# Altium schematic sheet 00_SYSTEM_OVERVIEW.SchDoc
size 840 x 594 mm
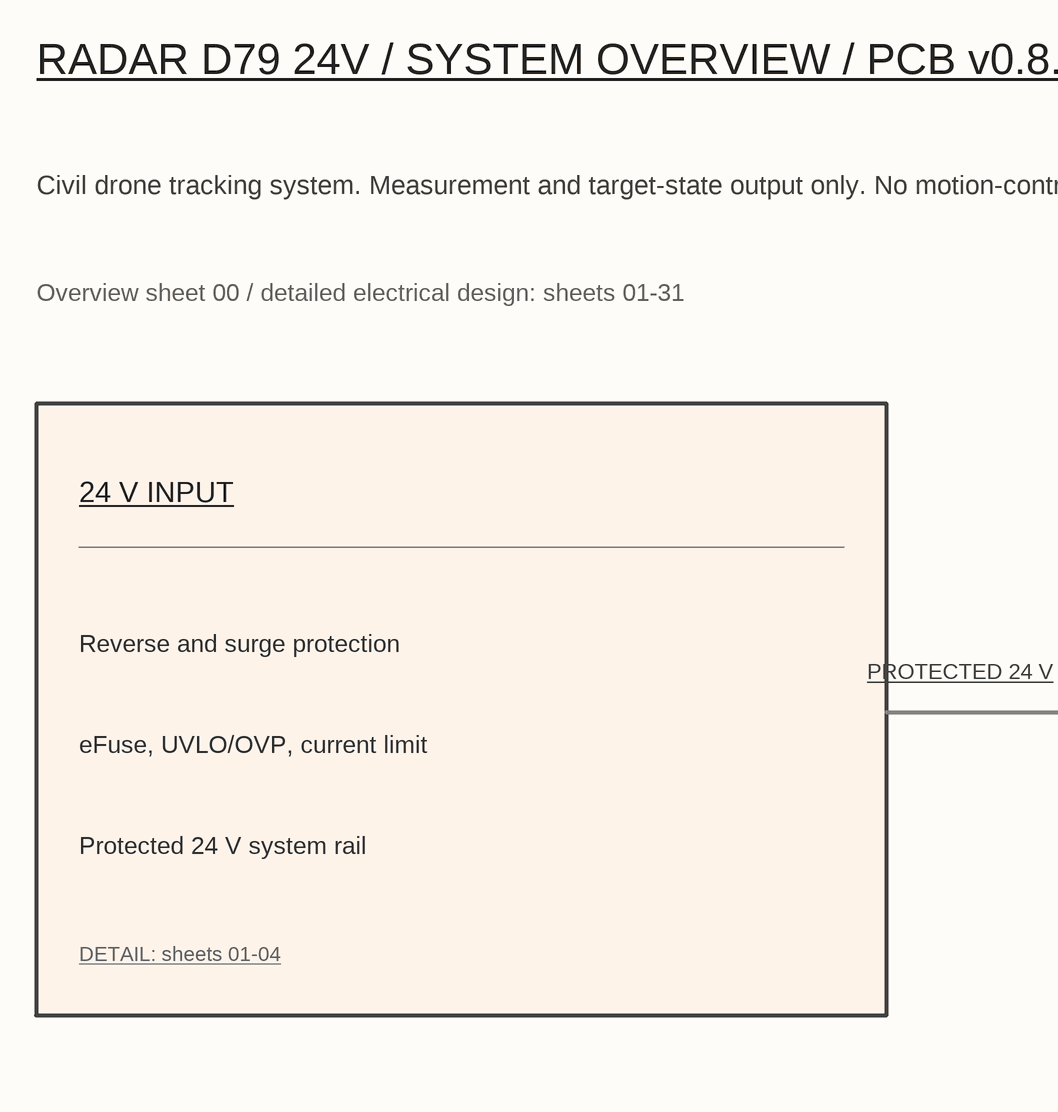
[diagram p0: 00_SYSTEM_OVERVIEW.SchDoc, top left]
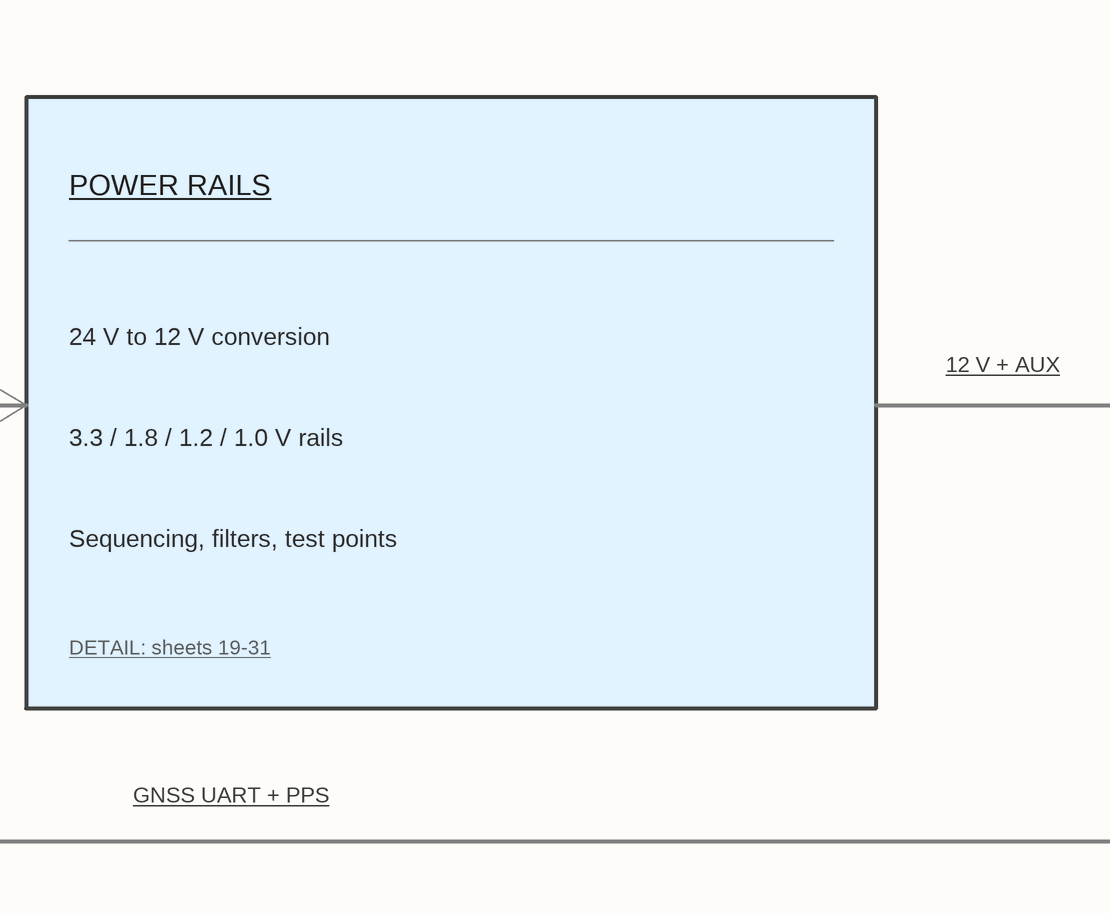
[diagram p1: 00_SYSTEM_OVERVIEW.SchDoc, top middle]
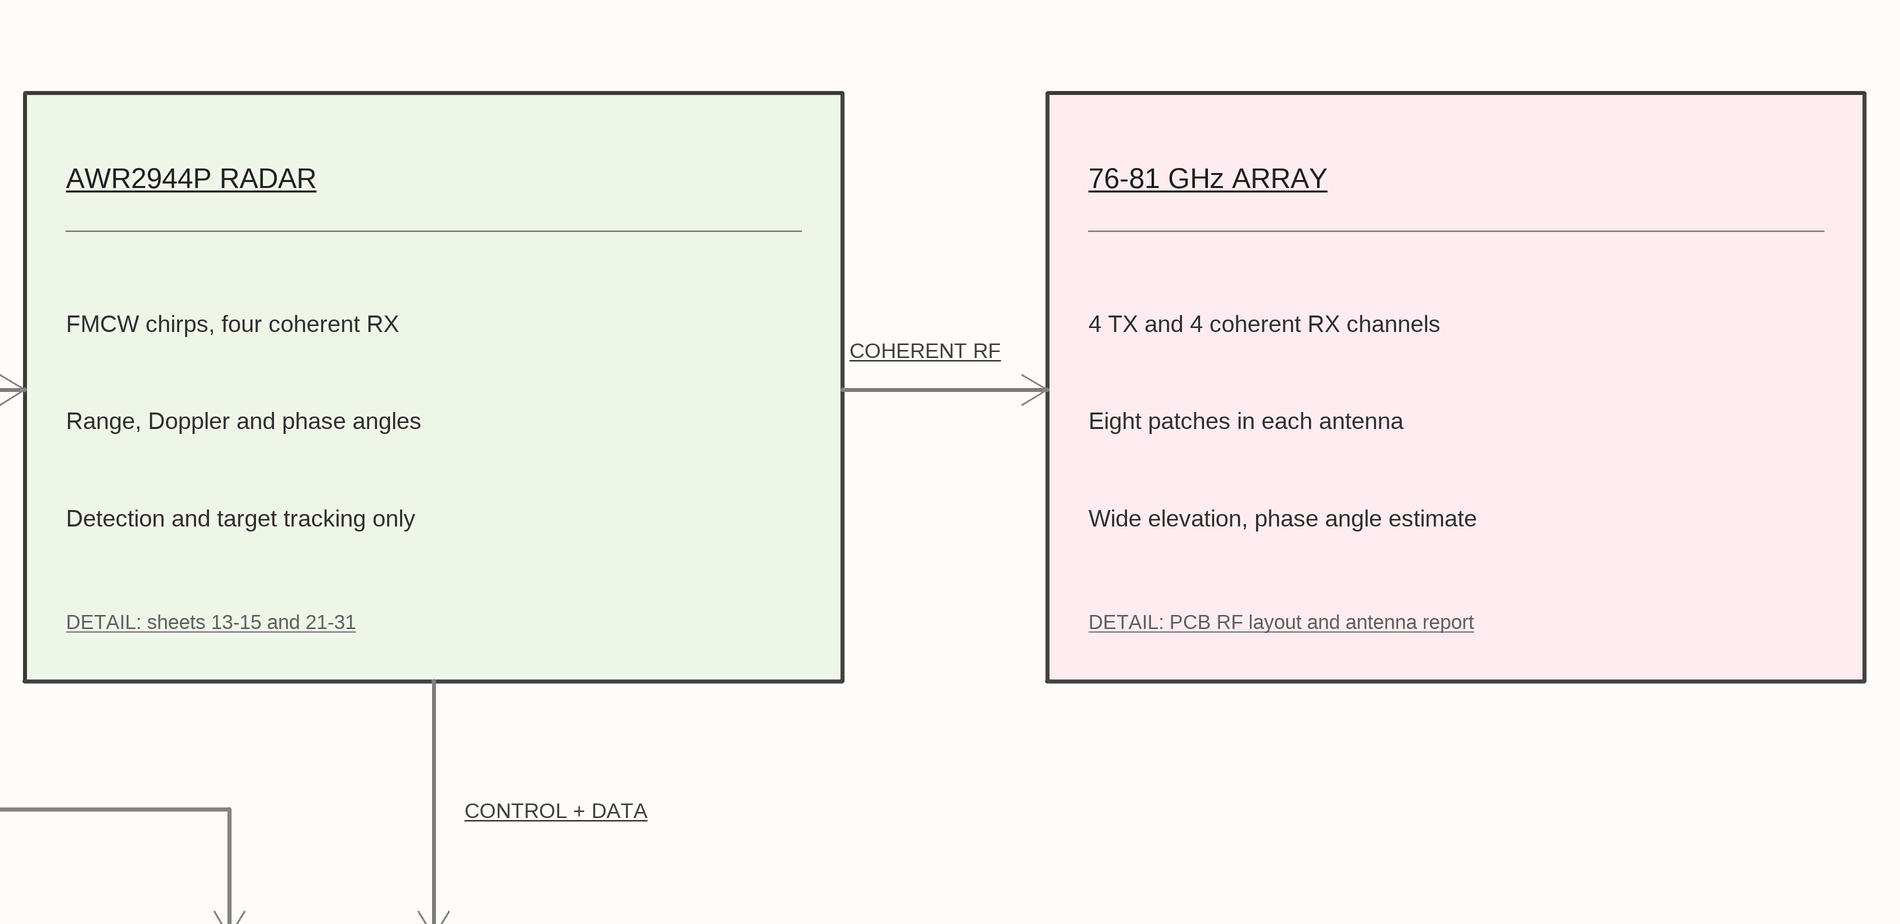
[diagram p2: 00_SYSTEM_OVERVIEW.SchDoc, top right]
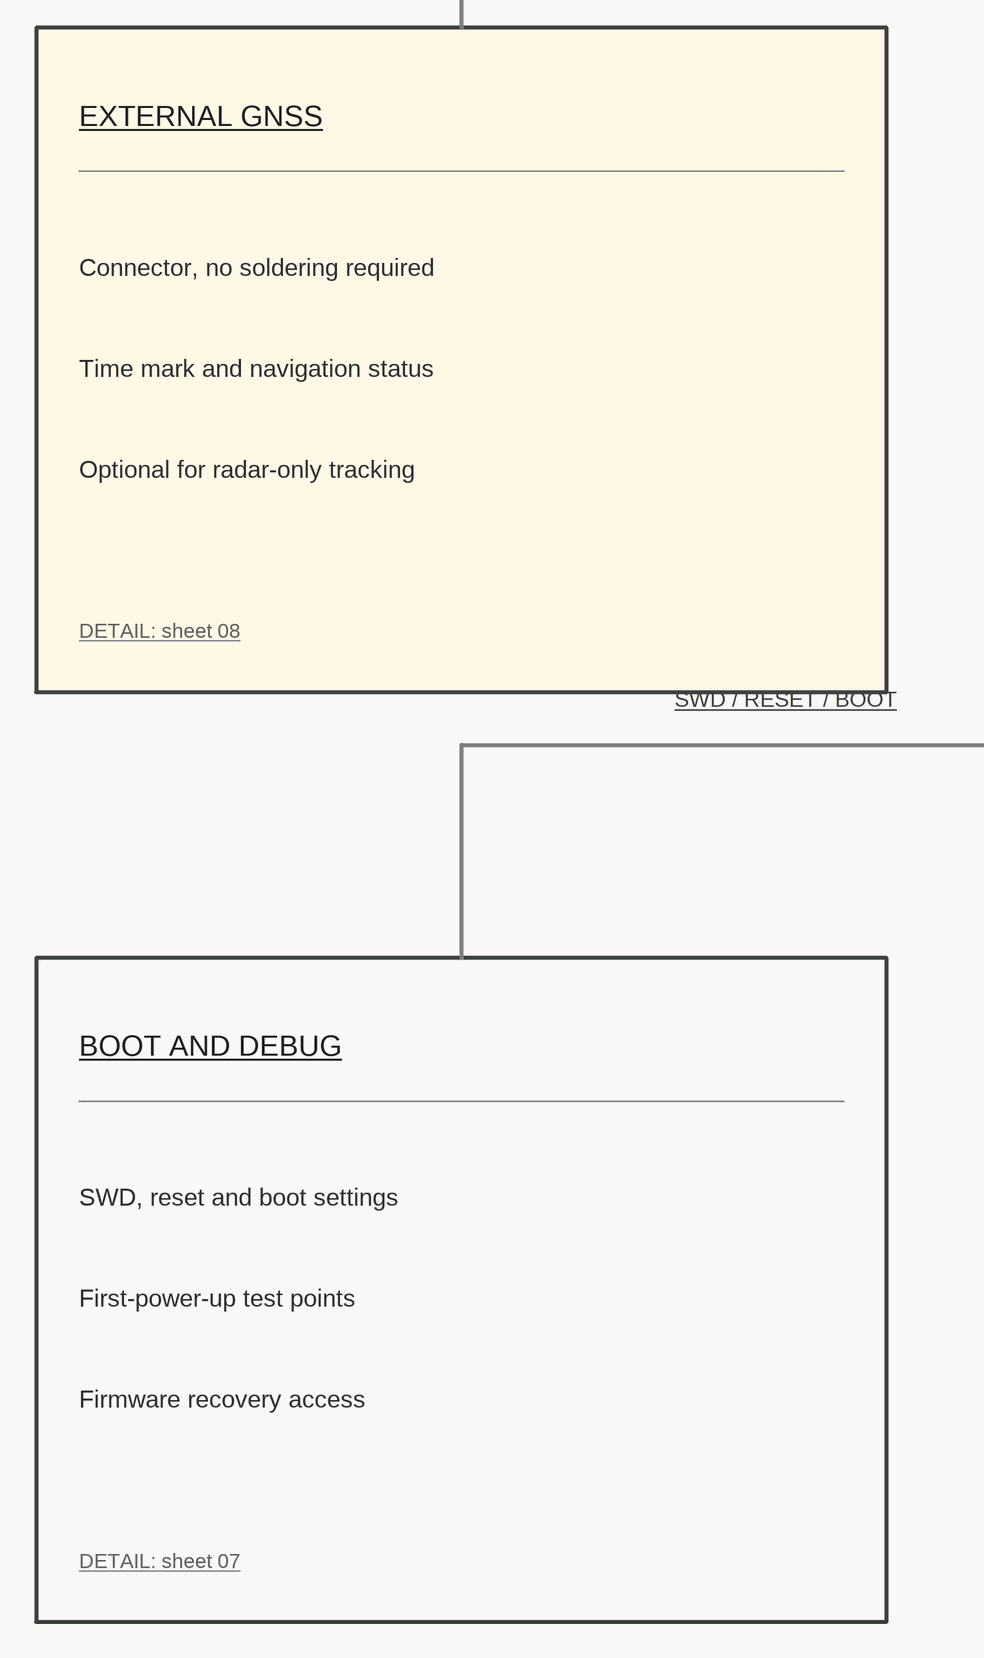
[diagram p3: 00_SYSTEM_OVERVIEW.SchDoc, bottom left]
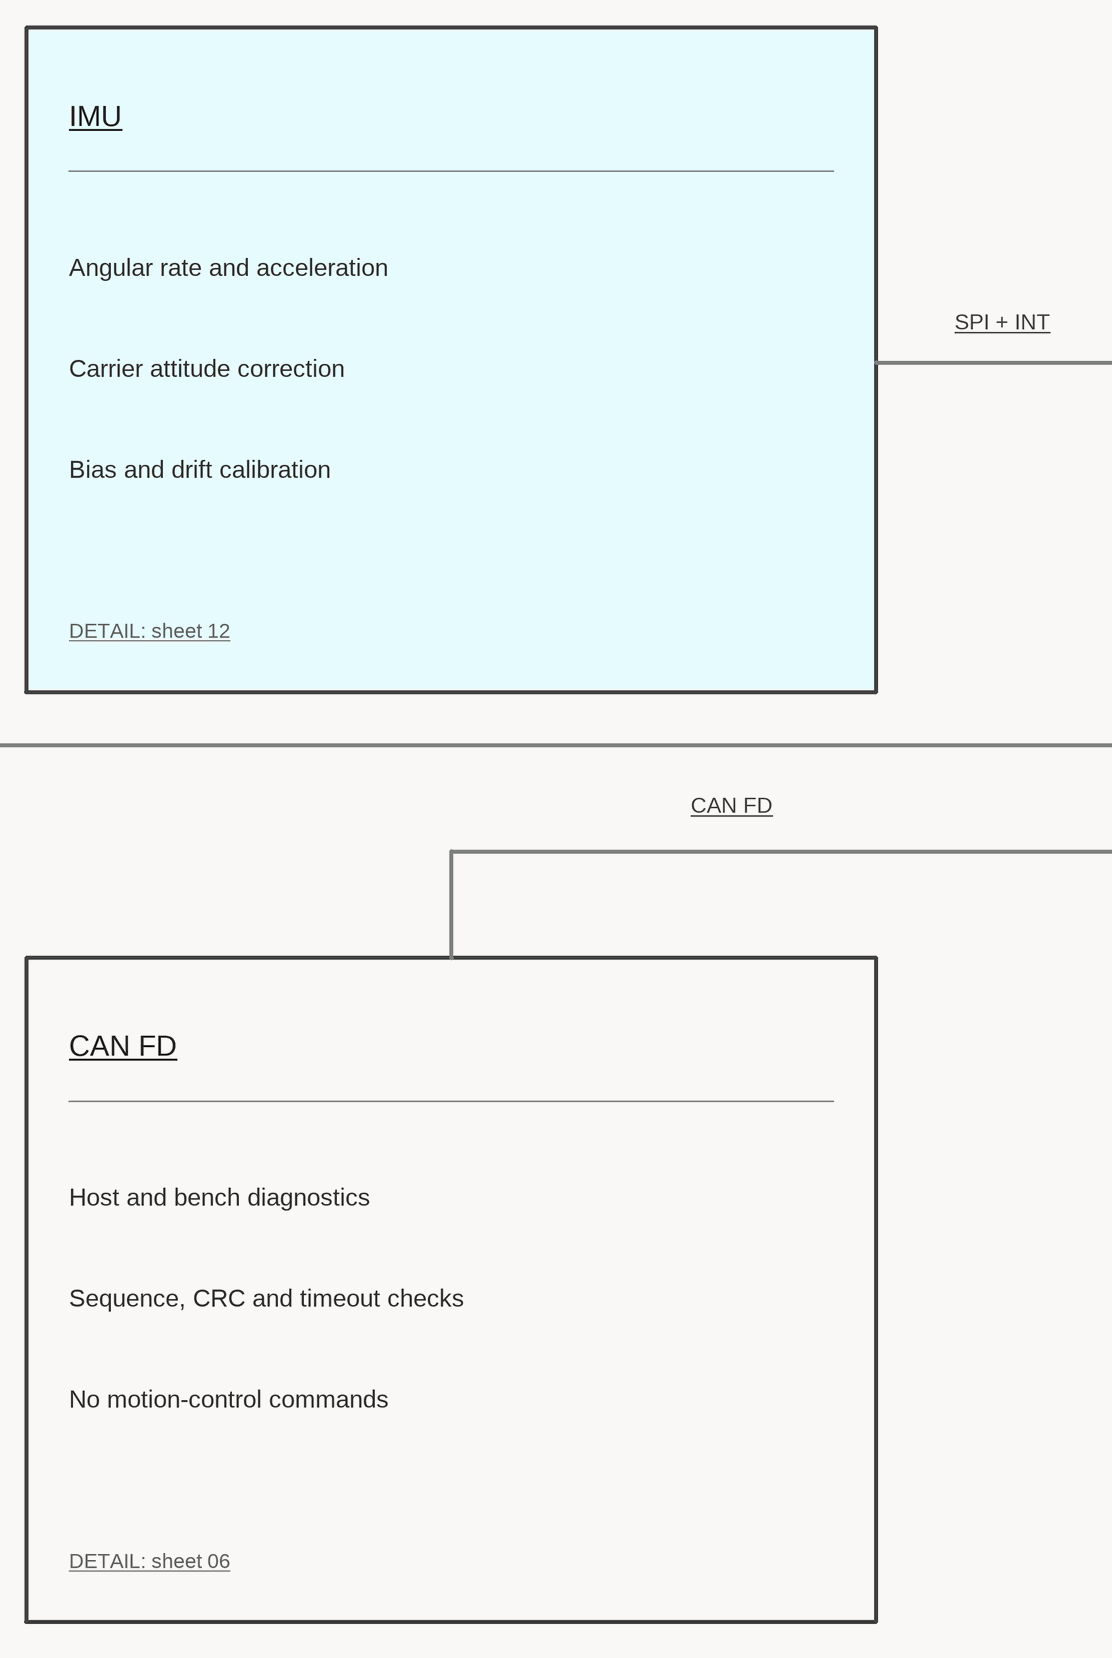
[diagram p4: 00_SYSTEM_OVERVIEW.SchDoc, bottom middle]
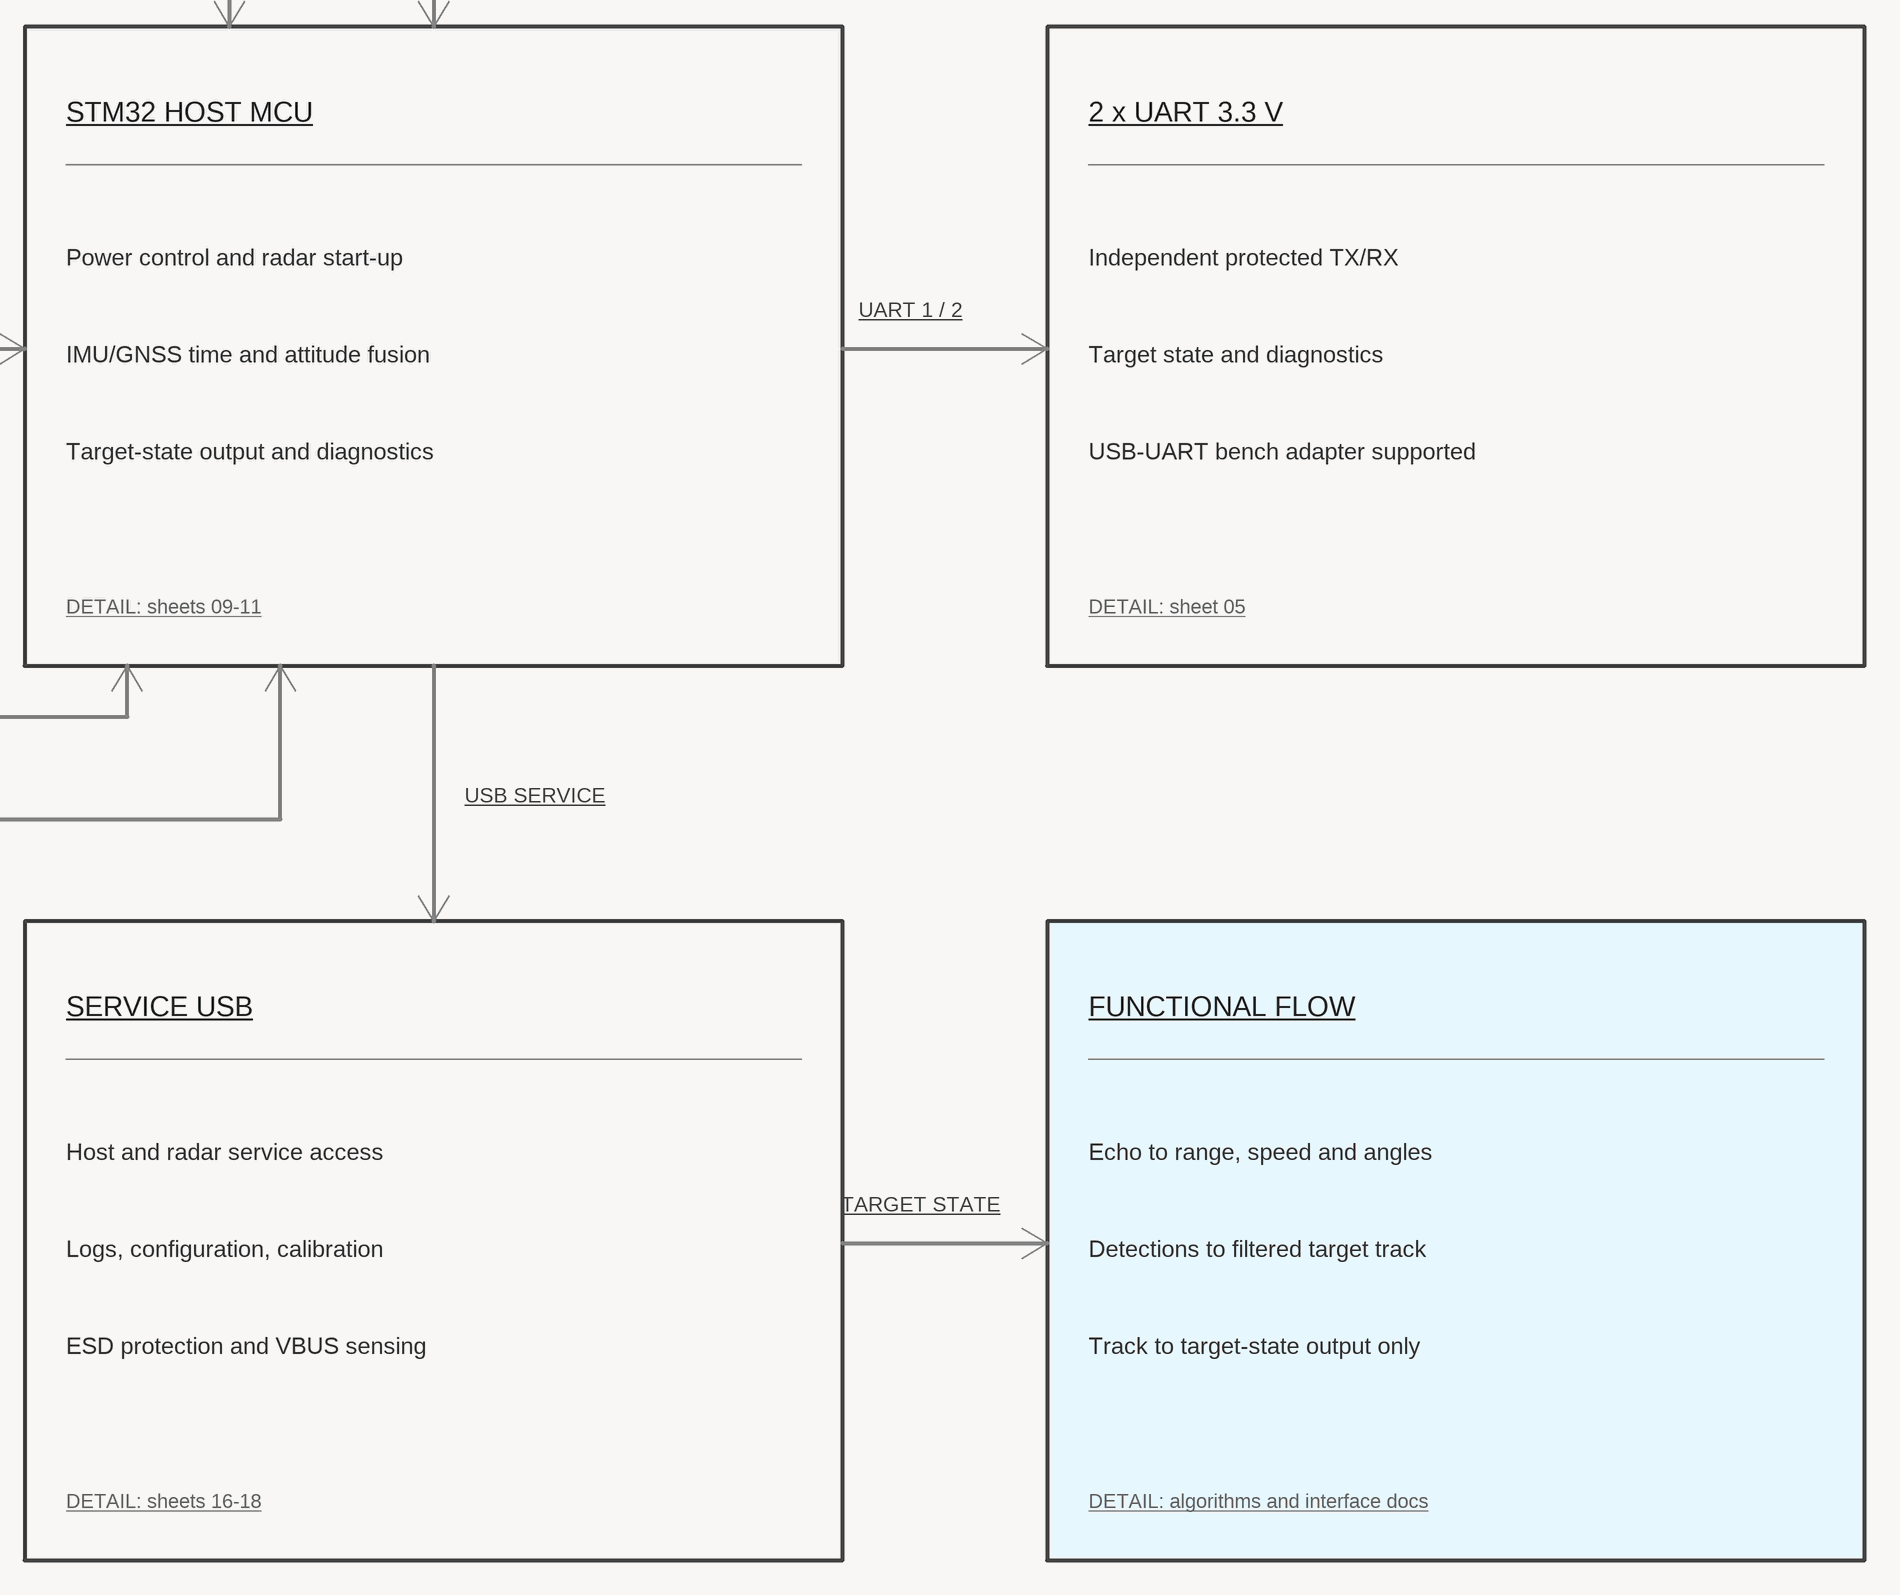
[diagram p5: 00_SYSTEM_OVERVIEW.SchDoc, bottom right]

## Notes on the sheet
- RADAR D79 24V / SYSTEM OVERVIEW / PCB v0.8.0 R9
- Civil drone tracking system. Measurement and target-state output only. No motion-control commands.
- Overview sheet 00 / detailed electrical design: sheets 01-31
- 24 V INPUT
- POWER RAILS
- AWR2944P RADAR
- 76-81 GHz ARRAY
- Reverse and surge protection
- PROTECTED 24 V
- 24 V to 12 V conversion
- 12 V + AUX
- FMCW chirps, four coherent RX
- COHERENT RF
- 4 TX and 4 coherent RX channels
- eFuse, UVLO/OVP, current limit
- 3.3 / 1.8 / 1.2 / 1.0 V rails
- Range, Doppler and phase angles
- Eight patches in each antenna
- Protected 24 V system rail
- Sequencing, filters, test points
- Detection and target tracking only
- Wide elevation, phase angle estimate
- DETAIL: sheets 01-04
- DETAIL: sheets 19-31
- DETAIL: sheets 13-15 and 21-31
- DETAIL: PCB RF layout and antenna report
- GNSS UART + PPS
- CONTROL + DATA
- EXTERNAL GNSS
- IMU
- STM32 HOST MCU
- 2 x UART 3.3 V
- Connector, no soldering required
- Angular rate and acceleration
- SPI + INT
- Power control and radar start-up
- UART 1 / 2
- Independent protected TX/RX
- Time mark and navigation status
- Carrier attitude correction
- IMU/GNSS time and attitude fusion
- Target state and diagnostics
- Optional for radar-only tracking
- Bias and drift calibration
- Target-state output and diagnostics
- USB-UART bench adapter supported
- DETAIL: sheet 08
- DETAIL: sheet 12
- DETAIL: sheets 09-11
- DETAIL: sheet 05
- SWD / RESET / BOOT
- CAN FD
- USB SERVICE
- BOOT AND DEBUG
- SERVICE USB
- FUNCTIONAL FLOW
- SWD, reset and boot settings
- Host and bench diagnostics
- Host and radar service access
- Echo to range, speed and angles
- TARGET STATE
- First-power-up test points
- Sequence, CRC and timeout checks
- Logs, configuration, calibration
- Detections to filtered target track
- Firmware recovery access
- No motion-control commands
- ESD protection and VBUS sensing
- Track to target-state output only
- DETAIL: sheet 07
- DETAIL: sheet 06
- DETAIL: sheets 16-18
- DETAIL: algorithms and interface docs